# Altium project İDA_2025_karti.PrjPcb
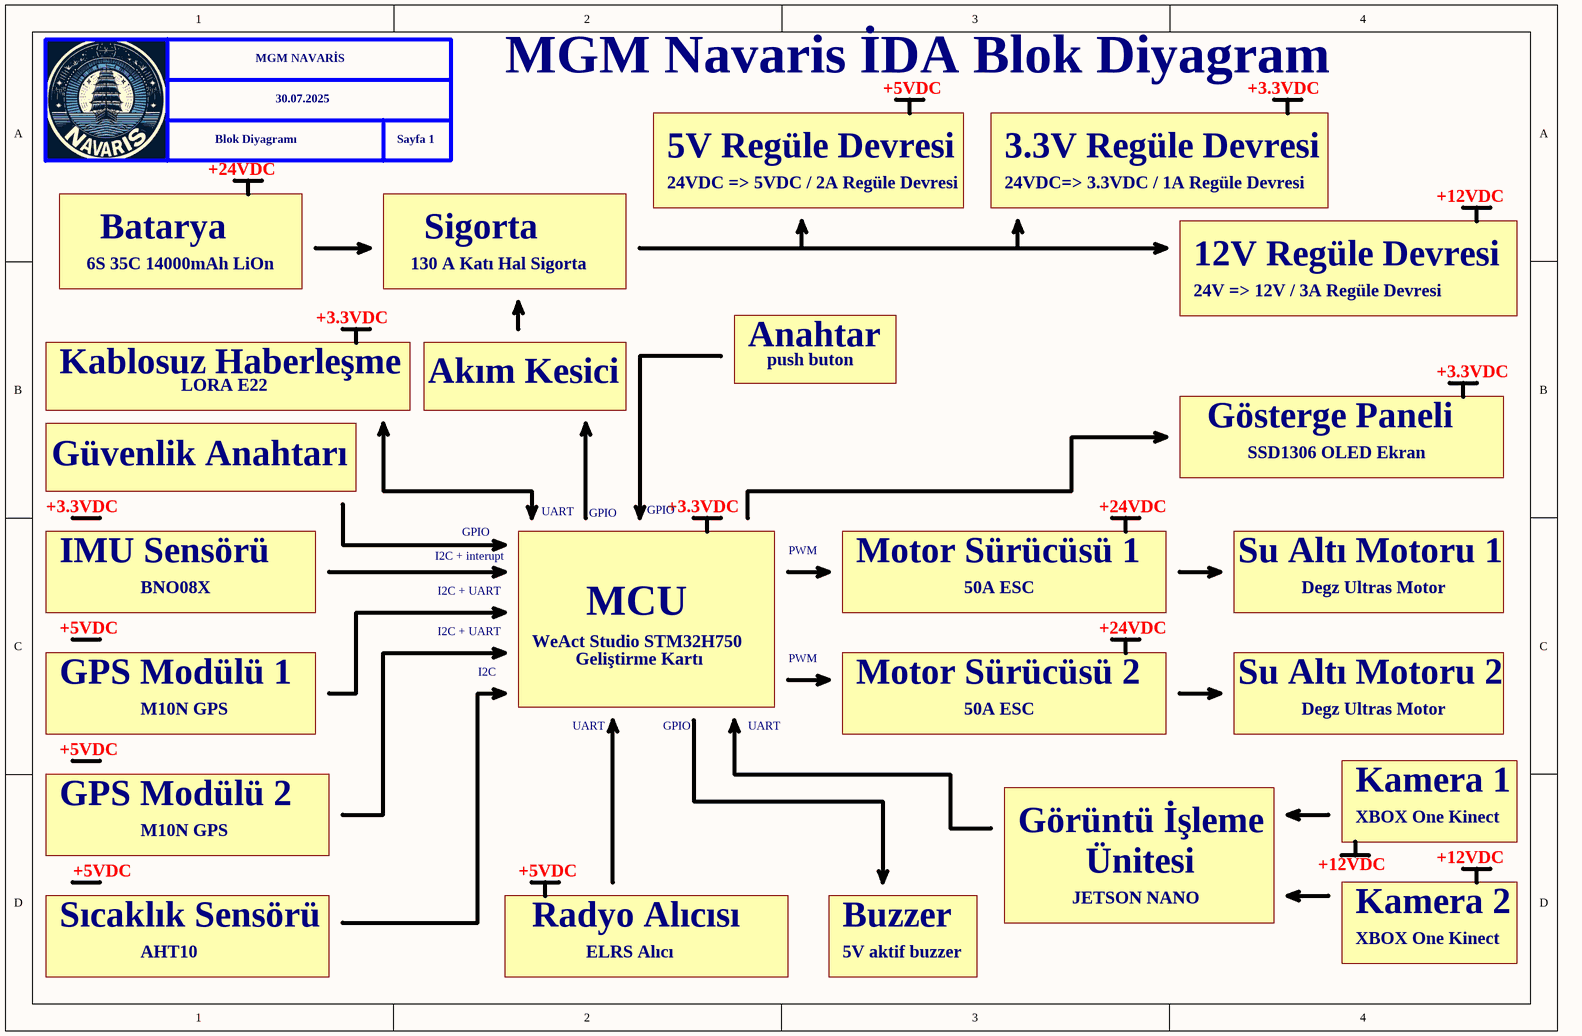
[diagram p0: 2025_İDA_Blok_Diyagram.SchDoc]
6 sheets, 47 parts. Net scope: global (net labels, ports and power ports of the same name join across sheets).
Board file: 2025_İDA_PCB_KARTI.PcbDoc
Sheets:
  2025_İDA_Blok_Diyagram.SchDoc
  STM32_Karti_Ve_Bağlantilari.SchDoc
  Guc_Devreleri.SchDoc
  Sensorler.SchDoc
  Haberlesme.SchDoc
  Kontrol_Devreleri.SchDoc

## Sheet 2025_İDA_Blok_Diyagram.SchDoc
size A4; SheetNumber: 1; SheetTotal: 6

### Notes on the sheet
- MGM NAVARİS
- 30.07.2025
- MGM Navaris İDA Blok Diyagram
- +5VDC
- +3.3VDC
- +24VDC
- Blok Diyagramı
- Sayfa 1
- 5V Regüle Devresi
- 3.3V Regüle Devresi
- Batarya
- Sigorta
- 24VDC => 5VDC / 2A Regüle Devresi
- 24VDC=> 3.3VDC / 1A Regüle Devresi
- +12VDC
- 6S 35C 14000mAh LiOn
- 130 A Katı Hal Sigorta
- 12V Regüle Devresi
- 24V => 12V / 3A Regüle Devresi
- Kablosuz Haberleşme
- Anahtar
- push buton
- LORA E22
- Akım Kesici
- Gösterge Paneli
- Güvenlik Anahtarı
- UART
- GPIO
- SSD1306 OLED Ekran
- IMU Sensörü
- I2C + interupt
- PWM
- Motor Sürücüsü 1
- Su Altı Motoru 1
- BNO08X
- I2C + UART
- WeAct Studio STM32H750
- MCU
- 50A ESC
- Degz Ultras Motor
- GPS Modülü 1
- M10N GPS
- I2C
- Geliştirme Kartı
- Motor Sürücüsü 2
- Su Altı Motoru 2
- GPS Modülü 2
- Görüntü İşleme
- Kamera 1
- XBOX One Kinect
- JETSON NANO
- Ünitesi
- Kamera 2
- Sıcaklık Sensörü
- AHT10
- Radyo Alıcısı
- ELRS Alıcı
- Buzzer
- 5V aktif buzzer

## Sheet STM32_Karti_Ve_Bağlantilari.SchDoc
size A4; SheetNumber: 2; SheetTotal: 6
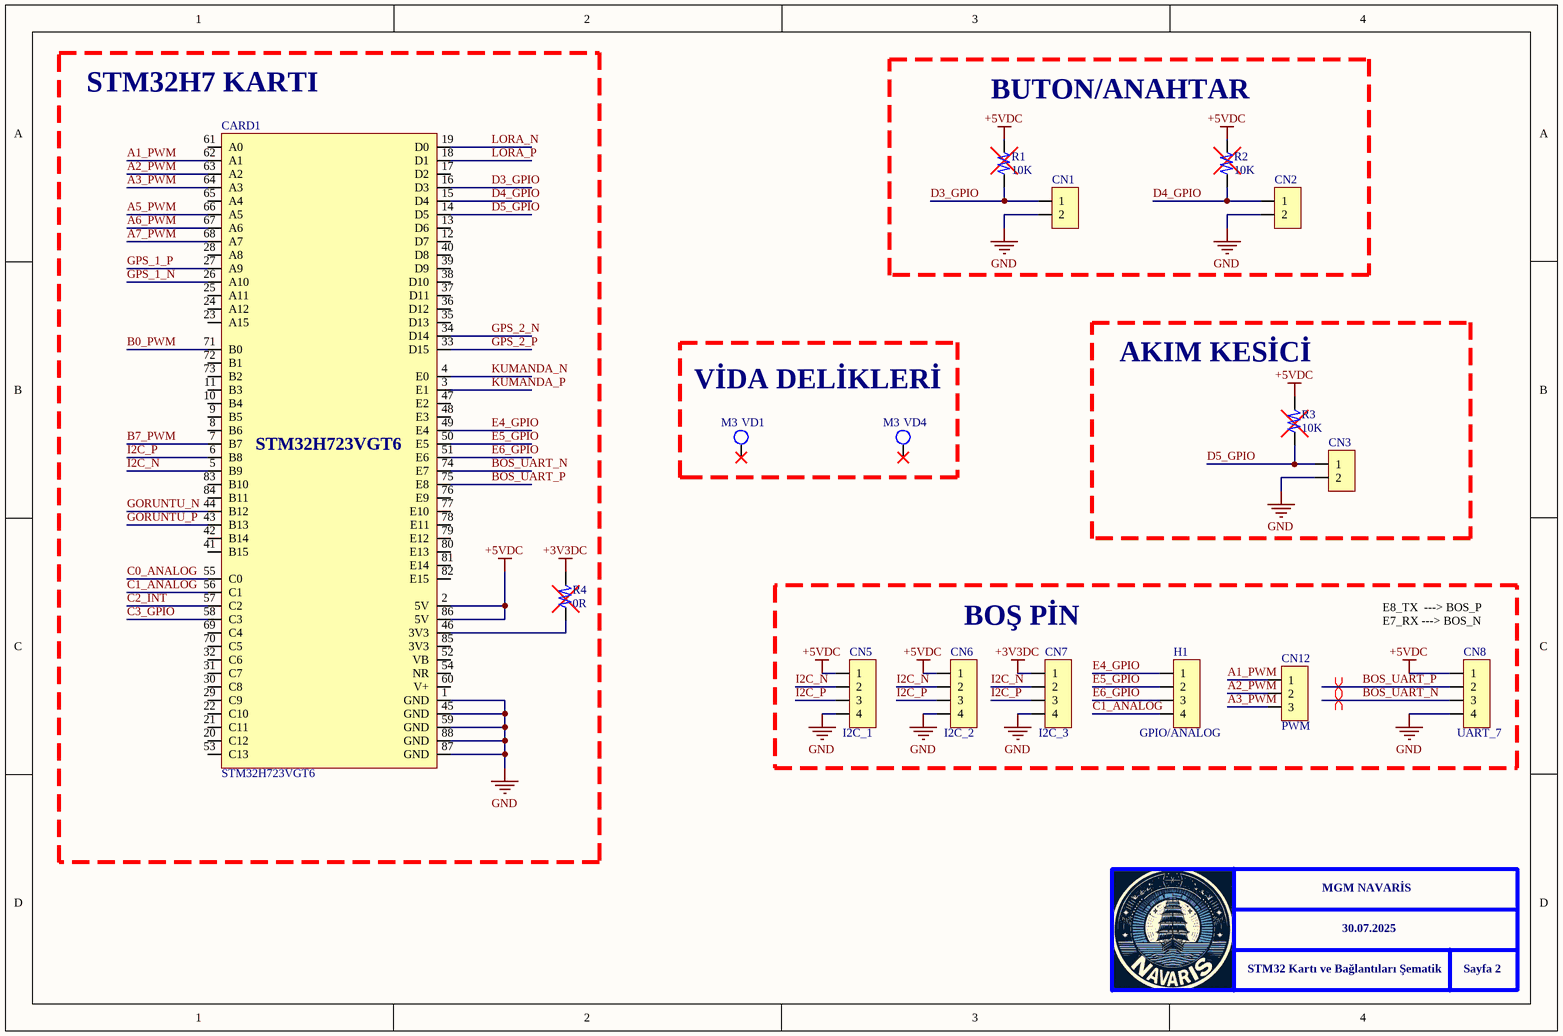
[diagram p1: STM32_Karti_Ve_Bağlantilari.SchDoc]

### Parts
CARD1  STM32H723VGT6  [STM32H723VGT6_gelistirme_karti]
CN1  Güvenlik Anahtarı  [2_Pin_JST_Male]  (value not drawn)
CN2  Güvenlik Anahtarı  [2_Pin_JST_Male]  (value not drawn)
CN3  Güvenlik Anahtarı  [2_Pin_JST_Male]  (value not drawn)
CN5  I2C_1  [4_Pin_JST_Male]
CN6  I2C_2  [4_Pin_JST_Male]
CN7  I2C_3  [4_Pin_JST_Male]
CN8  UART_7  [4_Pin_JST_Male]
CN12  PWM  [3_Pin_JST_Male]
H1  GPIO/ANALOG  [4_pin_header_2.54mm_FEMALE]
R1  10K  [1206_RES]
R2  10K  [1206_RES]
R3  10K  [1206_RES]
R4  0R  [1206_RES]
VD1  M3  [Vida_Deliği]
VD4  M3  [Vida_Deliği]

### Blocks framed on the sheet
STM32H7 KARTI: CARD1 R4
AKIM KESİCİ: CN3 R3
BOŞ PİN: CN5-CN8 CN12 H1

### Nets
+3V3DC: CN7.1 R4.2
+5VDC: CARD1.2(5V) CARD1.86(5V) CN5.1 CN6.1 CN8.1 R1.2 R2.2 R3.2
GND: CARD1.1(GND) CARD1.45(GND) CARD1.59(GND) CARD1.87(GND) CARD1.88(GND) CN1.2 CN2.2 CN3.2 CN5.4 CN6.4 CN7.4 CN8.4
A1_PWM: CARD1.62(A1) CN12.1
A2_PWM: CARD1.63(A2) CN12.2
A3_PWM: CARD1.64(A3) CN12.3
A5_PWM: CARD1.66(A5)
A6_PWM: CARD1.67(A6)
A7_PWM: CARD1.68(A7)
B0_PWM: CARD1.71(B0)
B7_PWM: CARD1.7(B7)
BOS_UART_N: CARD1.74(E7) CN8.3
BOS_UART_P: CARD1.75(E8) CN8.2
C0_ANALOG: CARD1.55(C0)
C1_ANALOG: CARD1.56(C1) H1.4
C2_INT: CARD1.57(C2)
C3_GPIO: CARD1.58(C3)
D3_GPIO: CARD1.16(D3) CN1.1 R1.1
D4_GPIO: CARD1.15(D4) CN2.1 R2.1
D5_GPIO: CARD1.14(D5) CN3.1 R3.1
E4_GPIO: CARD1.49(E4) H1.1
E5_GPIO: CARD1.50(E5) H1.2
E6_GPIO: CARD1.51(E6) H1.3
GORUNTU_N: CARD1.44(B12)
GORUNTU_P: CARD1.43(B13)
GPS_1_N: CARD1.26(A10)
GPS_1_P: CARD1.27(A9)
GPS_2_N: CARD1.34(D14)
GPS_2_P: CARD1.33(D15)
I2C_N: CARD1.5(B9) CN5.2 CN6.2 CN7.2
I2C_P: CARD1.6(B8) CN5.3 CN6.3 CN7.3
KUMANDA_N: CARD1.4(E0)
KUMANDA_P: CARD1.3(E1)
LORA_N: CARD1.19(D0)
LORA_P: CARD1.18(D1)
NetCARD1_46: CARD1.46(3V3) R4.1

Not connected (* = marked no-connect by the designer): CARD1 8(B6) 9(B5) 10(B4) 11(B3) 12(D7) 13(D6) 17(D2) 20(C12) 21(C11) 22(C10) 23(A15) 24(A12) 25(A11) 28(A8) 29(C9) 30(C8) 31(C7) 32(C6) 35(D13) 36(D12) 37(D11) 38(D10) 39(D9) 40(D8) 41(B15) 42(B14) 47(E2) 48(E3) 52(VB) 53(C13) 54(NR) 60(V+) 61(A0) 65(A4) 69(C4) 70(C5) 72(B1) 73(B2) 76(E9) 77(E10) 78(E11) 79(E12) 80(E13) 81(E14) 82(E15) 83(B10) 84(B11) 85(3V3); VD1 1*; VD4 1*

### Layout directives
differential pair; net class DIFF_BOS_UART: BOS_UART_N, BOS_UART_P

### Notes on the sheet
- BUTON/ANAHTAR
- VİDA DELİKLERİ
- (near CN8) E8_TX  ---> BOS_P
  E7_RX ---> BOS_N
- MGM NAVARİS
- STM32 Kartı ve Bağlantıları Şematik
- 30.07.2025
- Sayfa 2

### Library data of the parts
CARD1 = STM32H723VGT6_gelistirme_karti_sematik
CN1-CN3 = 2_Pin_JST_Male
CN5-CN8 = 4_Pin_JST_Male
CN12 = 3_Pin_JST_Male
H1 = 4_pin_header_female
R1-R4 = 1206_RES
VD1 VD4 = Vida_Deliği

## Sheet Guc_Devreleri.SchDoc
size A4; SheetNumber: 3; SheetTotal: 6
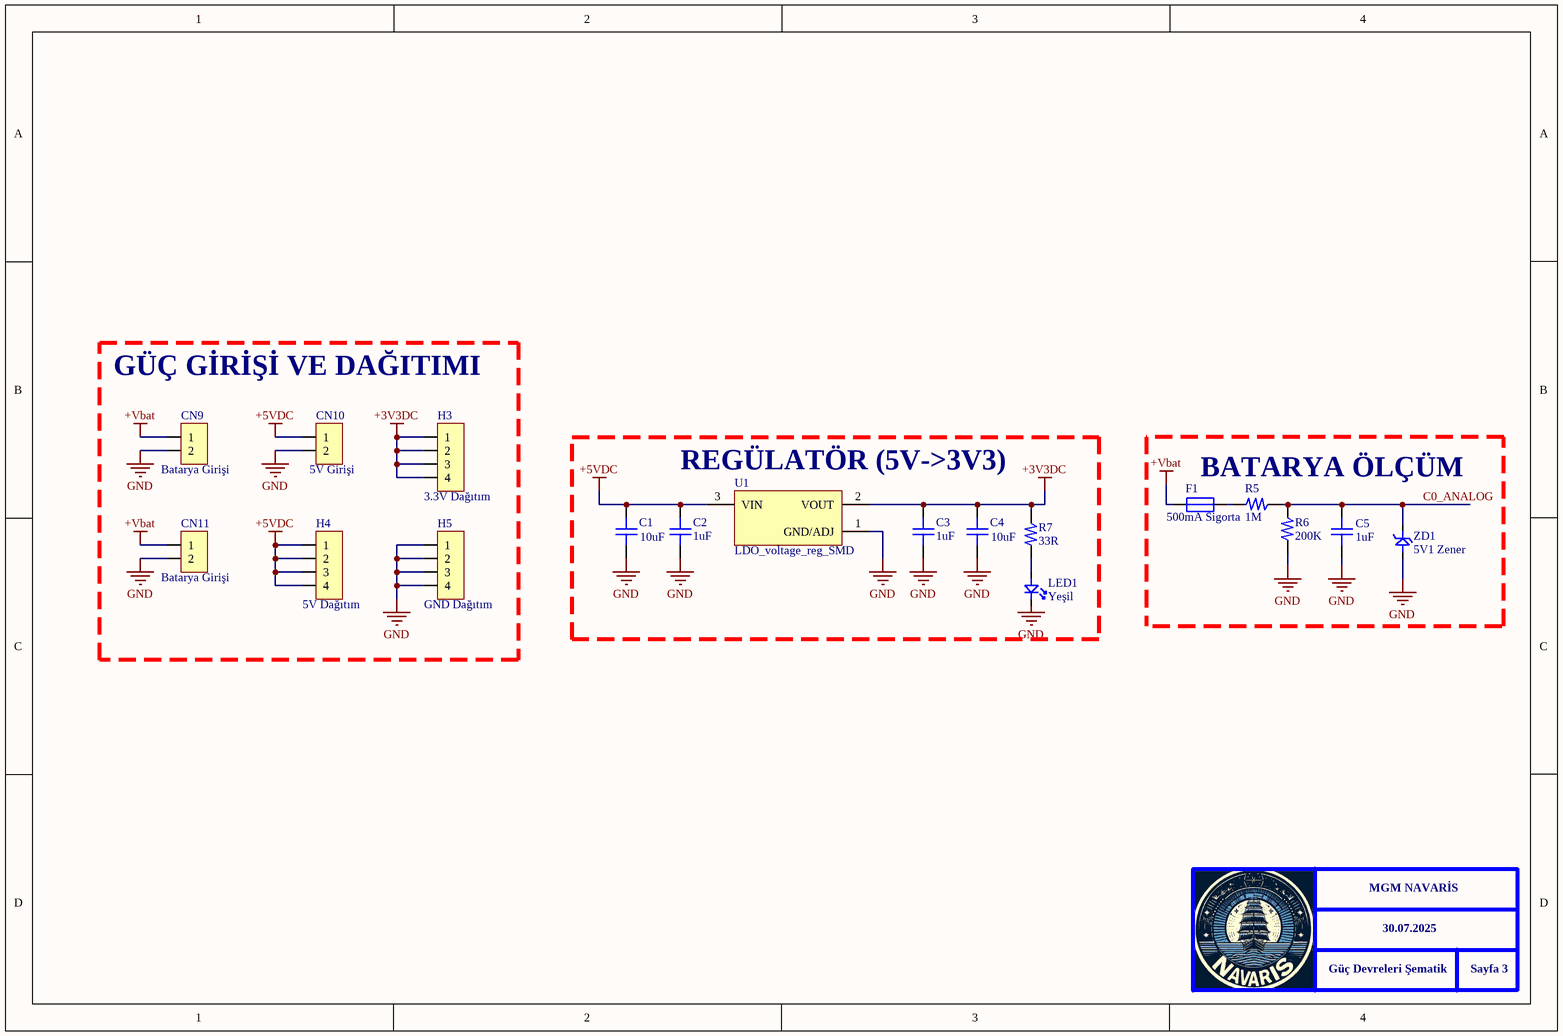
[diagram p2: Guc_Devreleri.SchDoc]

### Parts
C1  10uF  [1206_CAP]
C2  1uF  [1206_CAP]
C3  1uF  [1206_CAP]
C4  10uF  [1206_CAP]
C5  1uF  [1206_CAP]
CN9  Batarya Girişi  [2_Pin_JST_Male]
CN10  5V Girişi  [2_Pin_JST_Male]
CN11  Batarya Girişi  [2_Pin_JST_Male]
F1  500mA Sigorta  [1808_Sigorta]
H3  3.3V Dağıtım  [4_pin_header_2.54mm_FEMALE]
H4  5V Dağıtım  [4_pin_header_2.54mm_FEMALE]
H5  GND Dağıtım  [4_pin_header_2.54mm_FEMALE]
LED1  Yeşil  [1206_LED]
R5  1M  [1206_RES]
R6  200K  [1206_RES]
R7  33R  [1206_RES]
U1  LDO_voltage_reg_SMD  [SOT229P700X180-4N]
ZD1  5V1 Zener  [SOD-123]

### Blocks framed on the sheet
REGÜLATÖR (5V->3V3): C1-C4 LED1 R7 U1

### Nets
+3V3DC: C3.2 C4.2 H3.1 H3.2 H3.3 H3.4 R7.2 U1.2(VOUT)
+5VDC: C1.2 C2.2 CN10.1 H4.1 H4.2 H4.3 H4.4 U1.3(VIN)
+Vbat: CN9.1 CN11.1 F1.1
GND: C1.1 C2.1 C3.1 C4.1 C5.1 CN9.2 CN10.2 CN11.2 H5.1 H5.2 H5.3 H5.4 LED1.2 R6.1 U1.1(GND/ADJ) ZD1.1
C0_ANALOG: C5.2 R5.2 R6.2 ZD1.2
NetF1_2: F1.2 R5.1
NetLED1_1: LED1.1 R7.1

### Notes on the sheet
- GÜÇ GİRİŞİ VE DAĞITIMI
- BATARYA ÖLÇÜM
- MGM NAVARİS
- Güç Devreleri Şematik
- 30.07.2025
- Sayfa 3

### Library data of the parts
C1-C5 = 1206_CAP
CN9-CN11 = 2_Pin_JST_Male
F1 = 1808_Sigorta
H3-H5 = 4_pin_header_female
LED1 = 1206_LED
R5-R7 = 1206_RES
U1 = AMS1117-3.3: Sot223/Pkg 1-Amp 3.3-Volt Low Drop Out Voltage Regulatator; MF: Advanced Monolithic Systems; Value: 3.3V_DC; Package: SOT-223 Seeed Technology; Check_prices: https://www.snapeda.com/parts/AMS1117-3.3/Advanced+Monolithic+Systems/view-part/?ref=eda; Price: None; Availability: Not in stock; MP: AMS1117-3.3; SnapEDA_Link: https://www.snapeda.com/parts/AMS1117-3.3/Advanced+Monolithic+Systems/view-part/?ref=snap; LCSC Part Number: C20611856
ZD1 = SMD_Zener_Diyot

## Sheet Sensorler.SchDoc
size A4; SheetNumber: 4; SheetTotal: 6
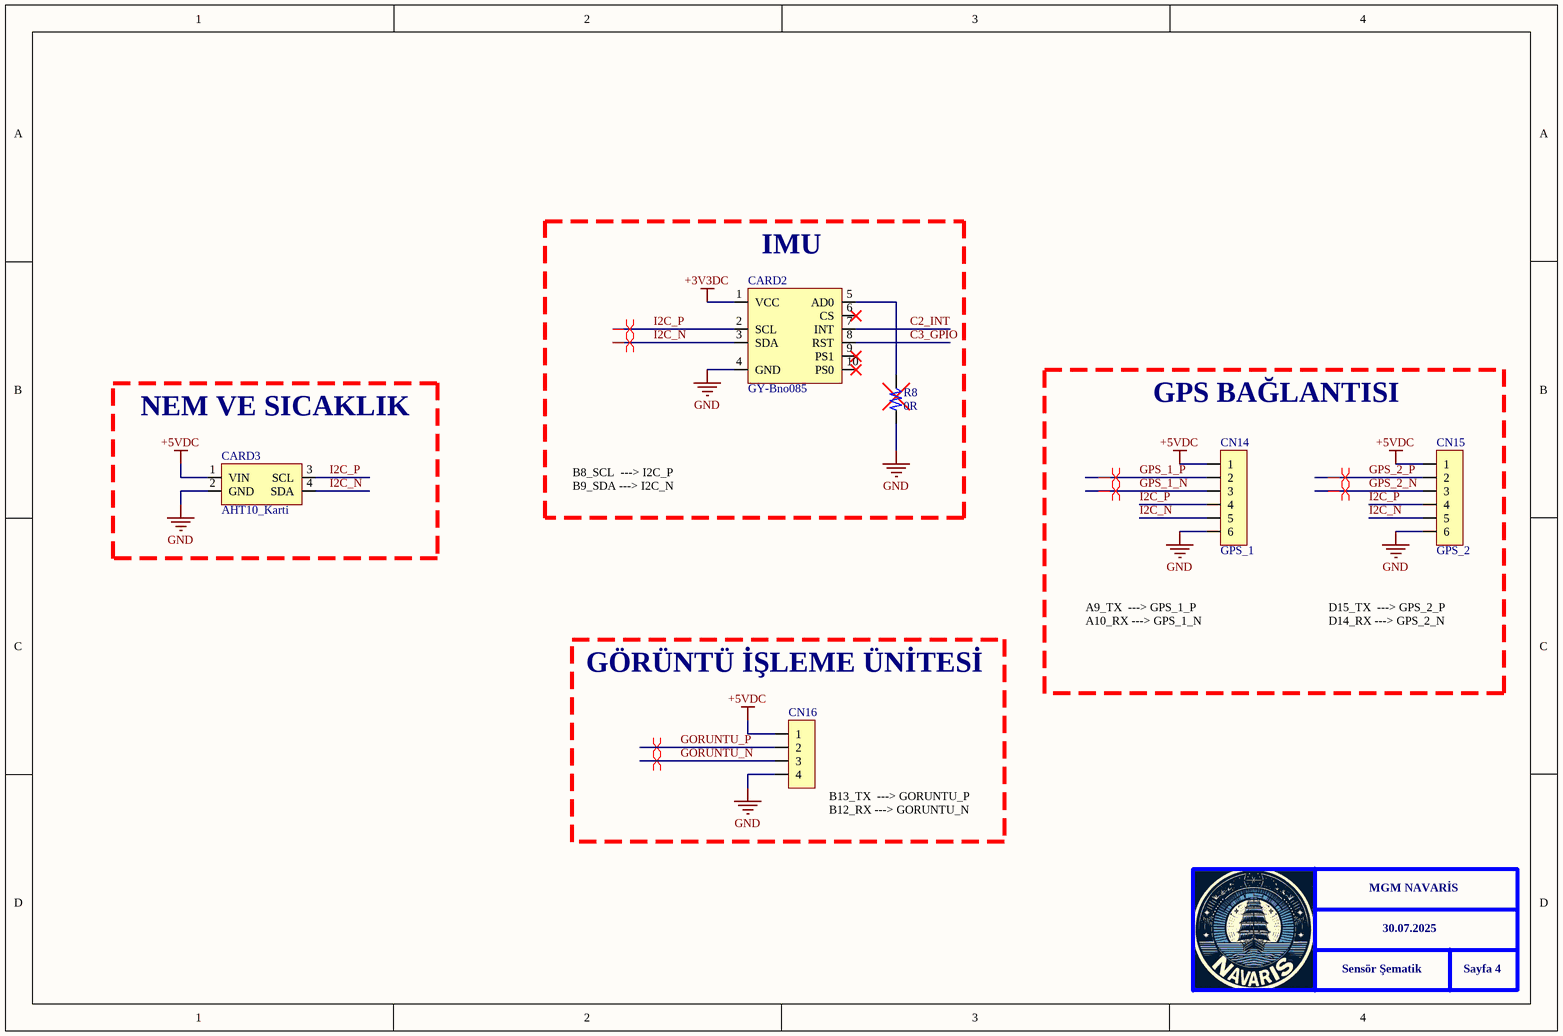
[diagram p3: Sensorler.SchDoc]

### Parts
CARD2  GY-Bno085  [Bno085_Kartı]
CARD3  AHT10_Karti  [AHT10_Karti_PCB]
CN14  GPS_1  [6_Pin_JST_Male]
CN15  GPS_2  [6_Pin_JST_Male]
CN16  4_Pin_JST_Male  [4_Pin_JST_Male]  (value not drawn)
R8  0R  [1206_RES]

### Blocks framed on the sheet
IMU: CARD2 R8
NEM VE SICAKLIK: CARD3
GPS BAĞLANTISI: CN14 CN15
GÖRÜNTÜ İŞLEME ÜNİTESİ: CN16

### Nets
+3V3DC: CARD2.1(VCC)
+5VDC: CARD3.1(VIN) CN14.1 CN15.1 CN16.1
GND: CARD2.4(GND) CARD3.2(GND) CN14.6 CN15.6 CN16.4 R8.1
C2_INT: CARD2.7(INT)
C3_GPIO: CARD2.8(RST)
GORUNTU_N: CN16.3
GORUNTU_P: CN16.2
GPS_1_N: CN14.3
GPS_1_P: CN14.2
GPS_2_N: CN15.3
GPS_2_P: CN15.2
I2C_N: CARD2.3(SDA) CARD3.4(SDA) CN14.5 CN15.5
I2C_P: CARD2.2(SCL) CARD3.3(SCL) CN14.4 CN15.4
NetCARD2_5: CARD2.5(AD0) R8.2

Not connected (* = marked no-connect by the designer): CARD2 6(CS)* 9(PS1)* 10(PS0)*

### Layout directives
differential pair; net class DIFF_GORUNTU: GORUNTU_N, GORUNTU_P
differential pair; net class DIFF_GPS_1: GPS_1_N, GPS_1_P
differential pair; net class DIFF_GPS_2: GPS_2_N, GPS_2_P
differential pair; net class DIFF_IMU: I2C_N, I2C_P

### Notes on the sheet
- B8_SCL  ---> I2C_P
  B9_SDA ---> I2C_N
- A9_TX  ---> GPS_1_P
  A10_RX ---> GPS_1_N
- D15_TX  ---> GPS_2_P
  D14_RX ---> GPS_2_N
- (near CN16) B13_TX  ---> GORUNTU_P
  B12_RX ---> GORUNTU_N
- MGM NAVARİS
- Sensör Şematik
- 30.07.2025
- Sayfa 4

### Library data of the parts
CARD2 = GY-Bno085: GY-BNO080 BNO085 9-Axis High Precision Acceleration and Gyro Sensor; ComponentLink1Description: Ürün Linki; ComponentLink1URL: https://www.motorobit.com/gy-bno080-bno085-9-eksen-yuksek-hassasiyetli-ivme-ve-gyro-sensoru
CARD3 = AHT10_Karti: Temperature and humidity sensor / Fully calibrated / • Digital output, I2C interface / • Excellent long-term stability / • SMD package reflow solderable / • Fast response and strong anti-interference ability; ComponentLink1Description: Product Datasheet; ComponentLink1URL: https://robu.in/wp-content/uploads/2021/01/AHT10.pdf; ComponentLink2Description: Product Datasheet 2; ComponentLink2URL: https://esphome.io/components/sensor/aht10.html
CN14 CN15 = 6_Pin_JST_Male
R8 = 1206_RES

## Sheet Haberlesme.SchDoc
size A4; SheetNumber: 5; SheetTotal: 6
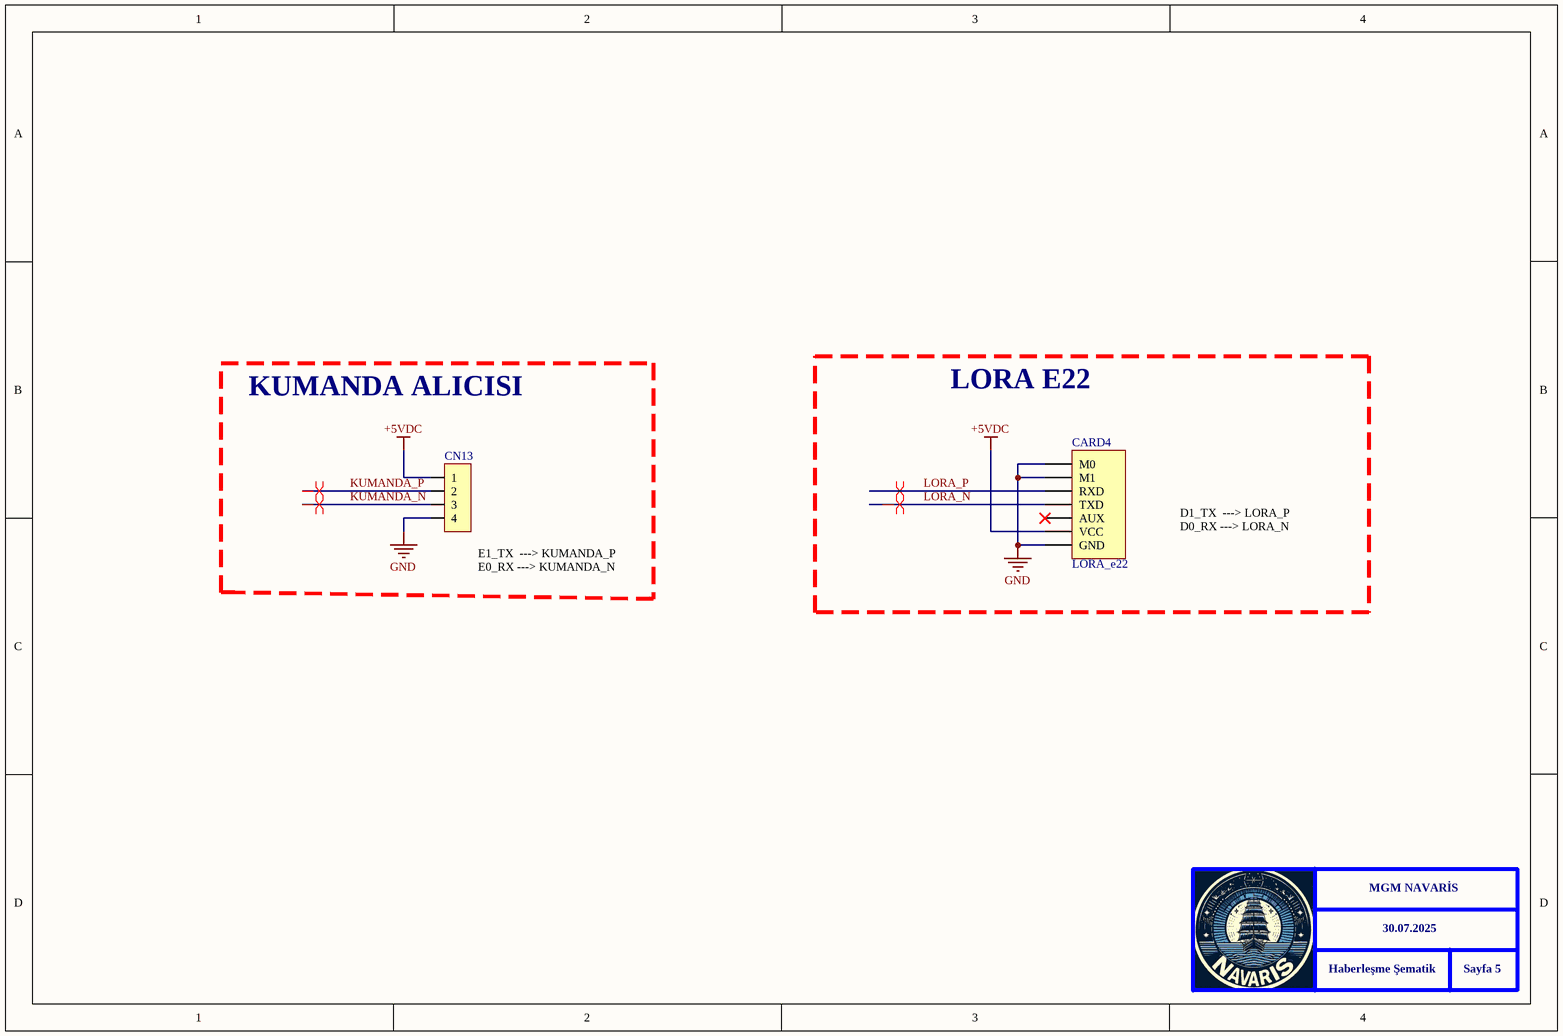
[diagram p4: Haberlesme.SchDoc]

### Parts
CARD4  LORA_e22  [LORA e22]
CN13  4_Pin_JST_Male  [4_Pin_JST_Male]  (value not drawn)

### Blocks framed on the sheet
LORA E22: CARD4

### Nets
+5VDC: CARD4.6(VCC) CN13.1
GND: CARD4.1(M0) CARD4.2(M1) CARD4.7(GND) CN13.4
KUMANDA_N: CN13.3
KUMANDA_P: CN13.2
LORA_N: CARD4.4(TXD)
LORA_P: CARD4.3(RXD)

Not connected (* = marked no-connect by the designer): CARD4 5(AUX)*

### Layout directives
differential pair; net class DIFF_LORA: LORA_N, LORA_P
differential pair; net class DIFF_KUMANDA: KUMANDA_N, KUMANDA_P

### Notes on the sheet
- KUMANDA ALICISI
- (near CN13) E1_TX  ---> KUMANDA_P
  E0_RX ---> KUMANDA_N
- D1_TX  ---> LORA_P
  D0_RX ---> LORA_N
- MGM NAVARİS
- Haberleşme Şematik
- 30.07.2025
- Sayfa 5

## Sheet Kontrol_Devreleri.SchDoc
size A4; SheetNumber: 6; SheetTotal: 6
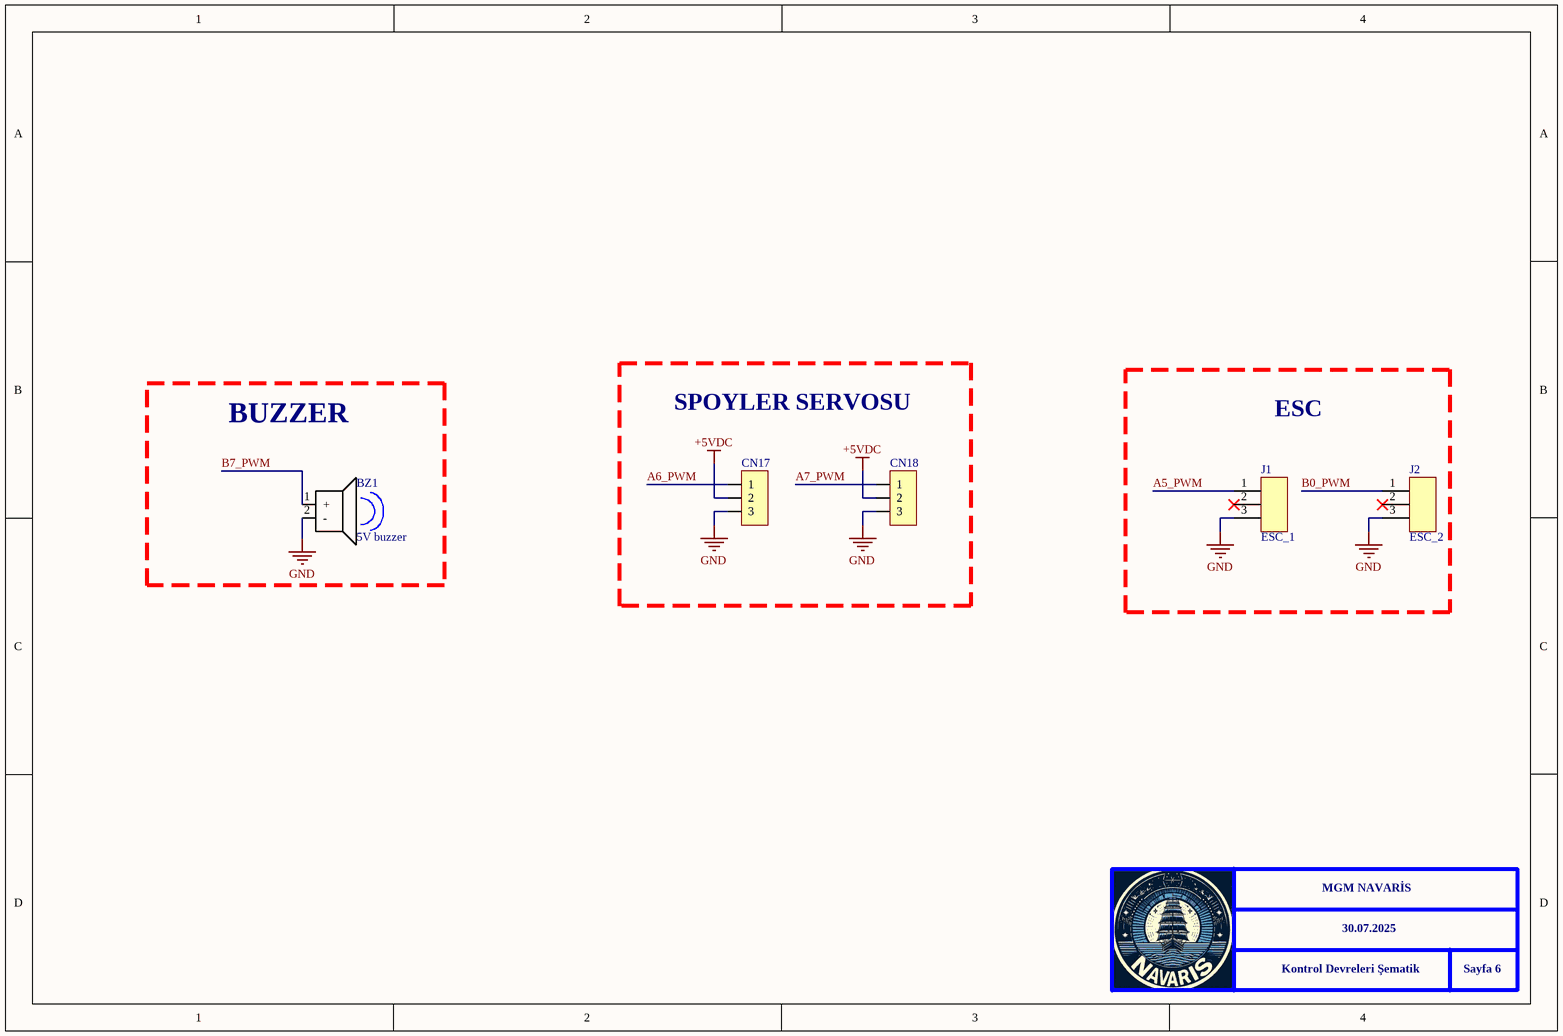
[diagram p5: Kontrol_Devreleri.SchDoc]

### Parts
BZ1  5V buzzer  [5v buzer]
CN17  3_Pin_JST_Male  [3_Pin_JST_Male]  (value not drawn)
CN18  3_Pin_JST_Male  [3_Pin_JST_Male]  (value not drawn)
J1  ESC_1  [HARWIN_M20-9990345]
J2  ESC_2  [HARWIN_M20-9990345]

### Blocks framed on the sheet
SPOYLER SERVOSU: CN17 CN18
ESC: J1 J2

### Nets
+5VDC: CN17.2 CN18.2
GND: BZ1.2(-) CN17.3 CN18.3 J1.3 J2.3
A5_PWM: J1.1
A6_PWM: CN17.1
A7_PWM: CN18.1
B0_PWM: J2.1
B7_PWM: BZ1.1(+)

Not connected (* = marked no-connect by the designer): J1 2*; J2 2*

### Notes on the sheet
- BUZZER
- MGM NAVARİS
- Kontrol Devreleri Şematik
- 30.07.2025
- Sayfa 6

### Library data of the parts
BZ1 = Buzzer
J1 J2 = M20-9990345: 2.54mm (0.1) Pitch SIL Vertical Throughboard Pin Header, 6.1mm mating pin height, gold (hi-temp mould), 3 contacts; MF: Harwin; SnapEDA_Link: https://www.snapeda.com/parts/M20-9990345/Harwin+Inc./view-part/?ref=snap; Package: None; Value: *; MP: M20-9990345; Check_prices: https://www.snapeda.com/parts/M20-9990345/Harwin+Inc./view-part/?ref=eda

## Nets that join several sheets
+3V3DC: STM32_Karti_Ve_Bağlantilari (CN7.1 R4.2), Guc_Devreleri (8 pins), Sensorler (CARD2.1)
+5VDC: STM32_Karti_Ve_Bağlantilari (8 pins), Guc_Devreleri (8 pins), Sensorler (CARD3.1 CN14.1 CN15.1 CN16.1), Haberlesme (CARD4.6 CN13.1), Kontrol_Devreleri (CN17.2 CN18.2)
GND: STM32_Karti_Ve_Bağlantilari (12 pins), Guc_Devreleri (16 pins), Sensorler (6 pins), Haberlesme (CARD4.1 CARD4.2 CARD4.7 CN13.4), Kontrol_Devreleri (5 pins)
A5_PWM: STM32_Karti_Ve_Bağlantilari (CARD1.66), Kontrol_Devreleri (J1.1)
A6_PWM: STM32_Karti_Ve_Bağlantilari (CARD1.67), Kontrol_Devreleri (CN17.1)
A7_PWM: STM32_Karti_Ve_Bağlantilari (CARD1.68), Kontrol_Devreleri (CN18.1)
B0_PWM: STM32_Karti_Ve_Bağlantilari (CARD1.71), Kontrol_Devreleri (J2.1)
B7_PWM: STM32_Karti_Ve_Bağlantilari (CARD1.7), Kontrol_Devreleri (BZ1.1)
C0_ANALOG: STM32_Karti_Ve_Bağlantilari (CARD1.55), Guc_Devreleri (C5.2 R5.2 R6.2 ZD1.2)
C2_INT: STM32_Karti_Ve_Bağlantilari (CARD1.57), Sensorler (CARD2.7)
C3_GPIO: STM32_Karti_Ve_Bağlantilari (CARD1.58), Sensorler (CARD2.8)
GORUNTU_N: STM32_Karti_Ve_Bağlantilari (CARD1.44), Sensorler (CN16.3)
GORUNTU_P: STM32_Karti_Ve_Bağlantilari (CARD1.43), Sensorler (CN16.2)
GPS_1_N: STM32_Karti_Ve_Bağlantilari (CARD1.26), Sensorler (CN14.3)
GPS_1_P: STM32_Karti_Ve_Bağlantilari (CARD1.27), Sensorler (CN14.2)
GPS_2_N: STM32_Karti_Ve_Bağlantilari (CARD1.34), Sensorler (CN15.3)
GPS_2_P: STM32_Karti_Ve_Bağlantilari (CARD1.33), Sensorler (CN15.2)
I2C_N: STM32_Karti_Ve_Bağlantilari (CARD1.5 CN5.2 CN6.2 CN7.2), Sensorler (CARD2.3 CARD3.4 CN14.5 CN15.5)
I2C_P: STM32_Karti_Ve_Bağlantilari (CARD1.6 CN5.3 CN6.3 CN7.3), Sensorler (CARD2.2 CARD3.3 CN14.4 CN15.4)
KUMANDA_N: STM32_Karti_Ve_Bağlantilari (CARD1.4), Haberlesme (CN13.3)
KUMANDA_P: STM32_Karti_Ve_Bağlantilari (CARD1.3), Haberlesme (CN13.2)
LORA_N: STM32_Karti_Ve_Bağlantilari (CARD1.19), Haberlesme (CARD4.4)
LORA_P: STM32_Karti_Ve_Bağlantilari (CARD1.18), Haberlesme (CARD4.3)